# Altium project Flyback Converter.PrjPcb
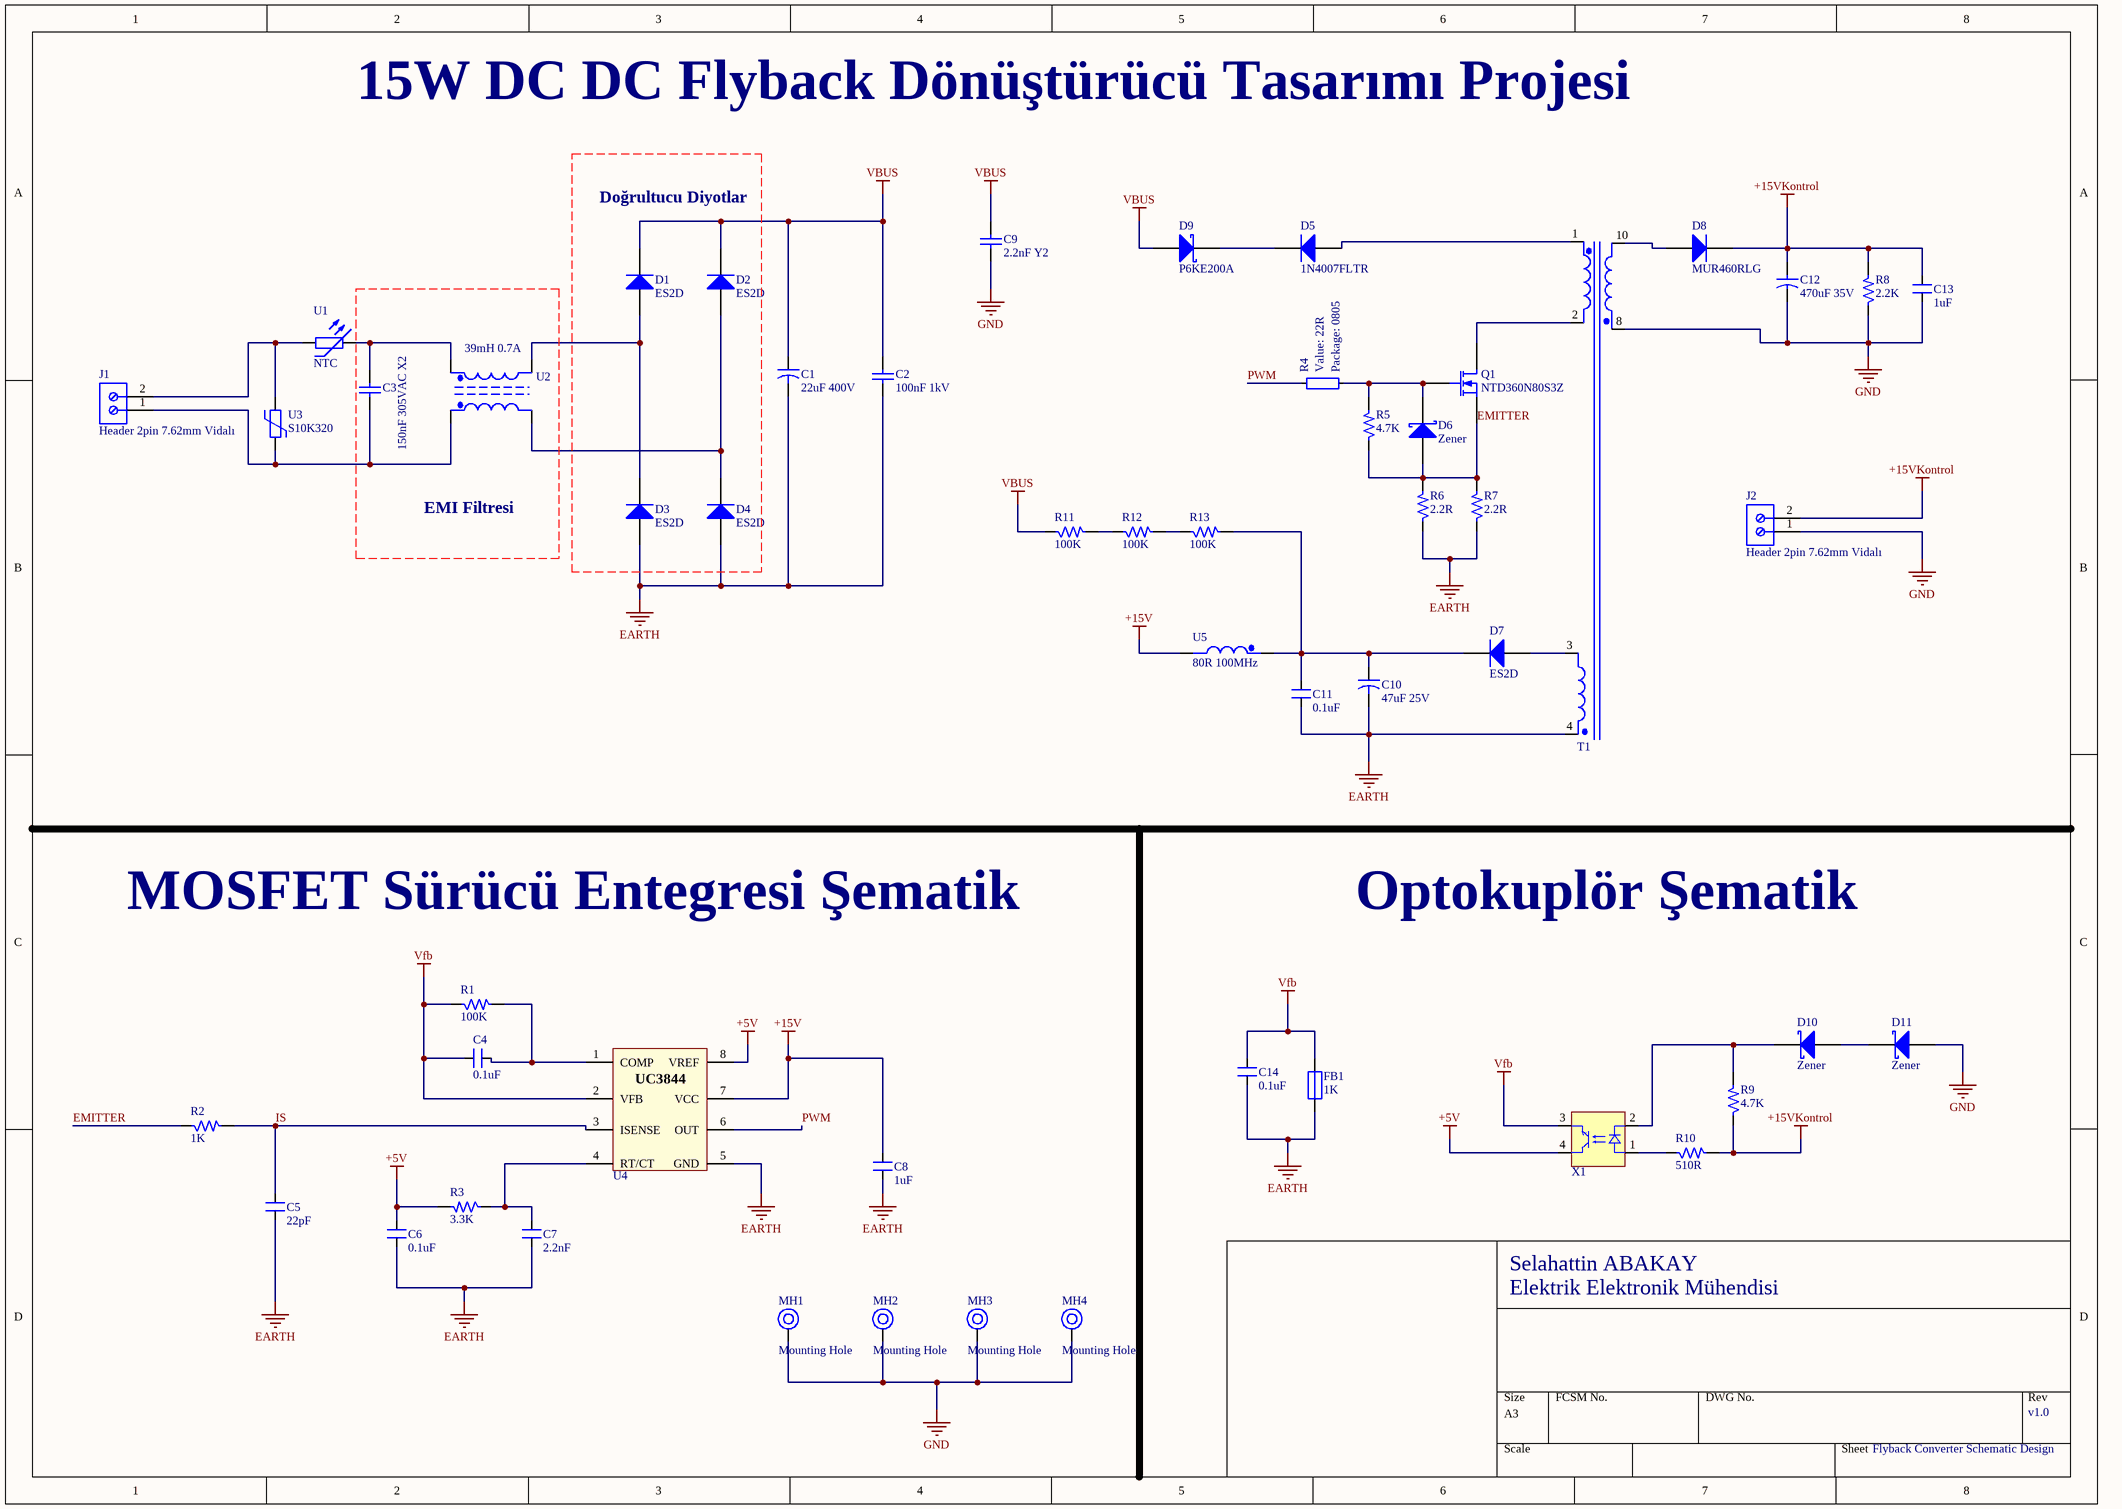
[diagram p0: Flyback Converter.SchDoc]
1 sheet, 53 parts. Net scope: global (net labels, ports and power ports of the same name join across sheets).
Board file: Flyback Converter.PcbDoc

## Sheet Flyback Converter.SchDoc
size A3

### Parts
C1  22uF 400V  [22uF 400V]
C2  100nF 1kV  [RCE7U2J333J5B1H03B]
C3  150nF 305VAC X2  [CFR F15 L18 B6 H12]
C4  0.1uF  [CAP_0805]
C5  22pF  [CAP_0805]
C6  0.1uF  [CAP_0805]
C7  2.2nF  [CAP_0805]
C8  1uF  [CAP_0805]
C9  2.2nF Y2  [4x13x9]
C10  47uF 25V  [CAPPRD200W50D525H1250]
C11  0.1uF  [CAP_0805]
C12  470uF 35V  [CAPPRD500W60D1025H1750]
C13  1uF  [CAP_0805]
C14  0.1uF  [CAP_0805]
D1  ES2D  [DO-214AA(SMB)]
D2  ES2D  [DO-214AA(SMB)]
D3  ES2D  [DO-214AA(SMB)]
D4  ES2D  [DO-214AA(SMB)]
D5  1N4007FLTR  [DO-214AA(SMB)]
D6  Zener  [SOD-123]
D7  ES2D  [DO-214AA(SMB)]
D8  MUR460RLG  [DO-201AD -Dik]
D9  P6KE200A  [DO-15((DO-204AC)]
D10  Zener  [SOD-123]
D11  Zener  [SOD-123]
FB1  1K  [IND_0805]
J1  Header 2pin 7.62mm Vidalı  [Header 2 Pin 7.62mm Vidalı]
J2  Header 2pin 7.62mm Vidalı  [Header 2 Pin 7.62mm Vidalı]
MH1  Mounting Hole  [MOUNTING]
MH2  Mounting Hole  [MOUNTING]
MH3  Mounting Hole  [MOUNTING]
MH4  Mounting Hole  [MOUNTING]
Q1  NTD360N80S3Z  [DPAK IGBT]
R1  100K  [RES_0805]
R2  1K  [RES_0603]
R3  3.3K  [RES_0805]
R4  value 22R  Package: 0805  [Resistor_Smd_M2012_I0805]  (hidden comment: Resistor)
R5  4.7K  [RES_0805]
R6  2.2R  [RES_0603]
R7  2.2R  [RES_0603]
R8  2.2K  [RES_0805]
R9  4.7K  [RES_0805]
R10  510R  [RES_0805]
R11  100K  [RES_0805]
R12  100K  [RES_0805]
R13  100K  [RES_0805]
T1  SMPS Tr  [SMPS Tr3]  (value not drawn)
U1  NTC  [NTC B57153S0100]
U2  39mH 0.7A  [EMC SMPS TDK]
U3  S10K320  [Varistor630V]
U4  UC3844  [SOIC-OA8_L]  (value not drawn)
U5  80R 100MHz  [1206 Bead]
X1  PC81710NIP1B  [PC817 SMD]  (value not drawn)

### Nets
+5V: C6.2 R3.2 U4.8(VREF) X1.4(C)
+15V: C8.2 U4.7(VCC) U5.2
+15VKontrol: C12.1 C13.2 D8.2(K) J2.2 R8.2 R9.1 R10.2
EARTH: C1.2 C2.1 C5.1 C6.1 C7.2 C8.1 C10.2 C11.1 C14.1 D3.1(A) D4.1(A) FB1.1 R6.1 R7.1 T1.4(Sec3-) U4.5(GND)
GND: C9.1 C12.2 C13.1 D11.1(A) J2.1 MH1.1 MH2.1 MH3.1 MH4.1 R8.1 T1.8
VBUS: C1.1 C2.2 C9.2 D1.2(K) D2.2(K) D9.1(A) R11.1
Vfb: C4.1 C14.2 FB1.2 R1.1 U4.2(VFB) X1.3(E)
EMITTER: D6.1(A) Q1.3(S) R2.1 R5.1 R6.2 R7.2
IS: C5.2 R2.2 U4.3(ISENSE)
PWM: R4.1 U4.6(OUT)
NetC3_1: C3.1 J1.1 U2.1 U3.1
NetC3_2: C3.2 U1.2 U2.2
NetC4_2: C4.2 R1.2 U4.1(COMP)
NetC7_1: C7.1 R3.1 U4.4(RT/CT)
NetC10_1: C10.1 C11.2 D7.2(K) R13.2 U5.1
NetD1_1: D1.1(A) D3.2(K) U2.3
NetD2_1: D2.1(A) D4.2(K) U2.4
NetD5_1: D5.1(A) T1.1(Pri+)
NetD5_2: D5.2(K) D9.2(K)
NetD6_2: D6.2(K) Q1.1(G) R4.2 R5.2
NetD7_1: D7.1(A) T1.3(Sec3+)
NetD8_1: D8.1(A) T1.10(Sec1+)
NetD10_1: D10.1(A) D11.2(K)
NetD10_2: D10.2(K) R9.2 X1.2(K)
NetJ1_2: J1.2 U1.1 U3.2
NetQ1_2: Q1.2(D) T1.2(Pri-)
NetR10_1: R10.1 X1.1(A)
NetR11_2: R11.2 R12.1
NetR12_2: R12.2 R13.1

### Notes on the sheet
- 15W DC DC Flyback Dönüştürücü Tasarımı Projesi
- Doğrultucu Diyotlar
- EMI Filtresi
- MOSFET Sürücü Entegresi Şematik
- Optokuplör Şematik
- Elektrik Elektronik Mühendisi
- Selahattin ABAKAY
- Flyback Converter Schematic Design
- v1.0

### Library data of the parts
C1 = C 22uF 400V 270mArms: 400AX22MEFC12.5X16; Manufacturer_Name: AVX; Manufacturer_Part_Number: TPSE107K020R0150; Allied_Number: 70002020; Datasheet Link: http://datasheets.avx.com/TPS.pdf; Height: 4.3mm; Mouser Part Number: 581-TPSE107K020R0150; Mouser Price/Stock: https://www.mouser.com/Search/Refine.aspx?Keyword=581-TPSE107K020R0150; RS Part Number: 1359911P; RS Price/Stock: http://uk.rs-online.com/web/p/products/1359911P; Allied Price/Stock: http://www.alliedelec.com/avx-tpse107k020r0150/70002020/
C2 = C Seramik 100nF 1kV X7R 5mm: 490-8944-ND; Published: 8-Jun-2000; LatestRevisionDate: 17-Jul-2002; LatestRevisionNote: Re-released for DXP Platform.; PackageReference: RAD-0.3; Publisher: Altium Limited; PackageDescription: Radial Cap, Thru-Hole; 2 Leads; 0.3 in Pin Spacing
C3 = Cap 150nF 305VAC X2: 1572-1789-ND; Part Number: 890273322005CS; Insulation Resistance: 30000MOhm; Dissipation Factor@100kHz: 0.26%; Dissipation Factor@1kHz: 0.1%; Pitch: 7.5mm; Rated Voltage: 250VDC; Rate of Voltage Rise: 340V/us; Technical Reference: MPPP075154J250DCPP45004; ComponentLink1Description: Manufacturer; ComponentLink1URL: http://www.we-online.de; ComponentLink2Description: Datasheet; ComponentLink2URL: https://katalog.we-online.com/pbs/datasheet/890273322005CS.pdf; Length: 10.5mm; Mounting Technology: THT; Packaging: Carton; Operating Temperature: -40 to +105degC; Width: 5mm; Capacitance: 150nF; Dissipation Factor@10kHz: 0.1%; Height: 11mm; Publisher: Wurth Elektronik; Published Date: August 2019
C4 C14 = CAP_0.1uF-50V-10%-0805: 0.1µF ±10% 50V Ceramic Capacitor X7R 0805 (2012 Metric) /; Manufacturer: Samsung; Manufacturer Part Number: CL21B104KBCNNNC; Alternate Part Number-1: NA; Case/Package: 0805; Supplier-1: SIRICOM; Supplier Part Number-1: 0805B104K500CT
C5 = CAP_22PF-50V-5%-0805: 22pF ±5% 50V Ceramic Capacitor C0G, NP0 0805 (2012 Metric) /; Manufacturer: Yageo; Manufacturer Part Number: CC0805JRNPO9BN220; Alternate Part Number-1: 0805CG220J500NT; Case/Package: 0805; Supplier-1: SIRICOM; Supplier Part Number-1: 0805N220J500CT
C6 C11 = CAP_0.1uF-50V-20%-0805: 0.1µF ±20% 50V Ceramic Capacitor X7R 0805 (2012 Metric) /; Manufacturer: Samsung Electro-Mechanics; Manufacturer Part Number: CL21B104MBCNNNC; Alternate Part Number-1: NA; Case/Package: 0805; Supplier-1: SIRICOM; Supplier Part Number-1: 0805B104K500CT
C7 = CAP_2.2nF-50V-10%-0805: 2200pF ±10% 50V Ceramic Capacitor C0G, NP0 0805 (2012 Metric) /; Manufacturer: KEMET; Manufacturer Part Number: C0805C222K5GEC7800; Alternate Part Number-1: NA; Case/Package: 0805; Supplier-1: SIRICOM; Supplier Part Number-1: 0805N222J500LT
C8 C13 = CAP_1uF-50V-5%-0805: 1µF ±5% 50V Ceramic Capacitor X7R 0805 (2012 Metric) /; Manufacturer: Samsung; Manufacturer Part Number: CC0805JKX7R9BB105; Alternate Part Number-1: 0805F105M500NT; Case/Package: 0805; Supplier-1: SIRICOM; Supplier Part Number-1: CL21B105KBFNNNE
C9 = Cap Y2 2.2nF 300V MKP TDK: 495-4967-1-ND; Published: 8-Jun-2000; LatestRevisionDate: 17-Jul-2002; LatestRevisionNote: Re-released for DXP Platform.; PackageReference: RAD-0.3; Publisher: Altium Limited; PackageDescription: Radial Cap, Thru-Hole; 2 Leads; 0.3 in Pin Spacing
C10 = C 47uF 25V 250mArms 400mOhm: 1189-1590-1-ND; ComponentLink1Description: http://www.rubycon.co.jp/en/catalog/e_pdfs/aluminum/e_px.pdf
C12 = C 470uF 35V 1.76A 28mOhm: 860040475008; Published: 8-Jun-2000; LatestRevisionDate: 17-Jul-2002; LatestRevisionNote: Re-released for DXP Platform.; PackageReference: RAD-0.3; Publisher: Altium Limited; PackageDescription: Radial Cap, Thru-Hole; 2 Leads; 0.3 in Pin Spacing
D1-D4 D7 = D ES2D: ES2DFSCT-ND
D5 = D 1N4007 DO-214AA(SMB): 1655-1N4007FLCT-ND
D6 D10 D11 = Zener SOD-123: SOD-123; Note: Pin 2 is not connected and not drawn.; Published: 21-Mar-2003; LatestRevisionDate: 29-May-2009; LatestRevisionNote: IPC-7351 Footprint Added.; DatasheetVersion: Oct-1999; PackageVersion: Sep-2001; PackageReference: SOT-23; Publisher: Altium Limited; PackageDescription: 3-Pin SOT-23 Package 0.95 mm Pitch, 2.5 mm Lead Span; ComponentLink1Description: Manufacturer Link; ComponentLink1URL: http://www.infineon.com/; ComponentLink2Description: Datasheet; ComponentLink2URL: http://www.infineon.com/upload/Document/cmc_upload/documents/009/363/bat17series.pdf
D8 = Diyot DO-201AD Dik: MUR460RLGOSCT-ND
D9 = TVS 200V DO-15: 497-13419-1-ND; Note: Pin 2 is not connected and not drawn.; Published: 21-Mar-2003; LatestRevisionDate: 29-May-2009; LatestRevisionNote: IPC-7351 Footprint Added.; DatasheetVersion: Oct-1999; PackageVersion: Sep-2001; PackageReference: SOT-23; Publisher: Altium Limited; PackageDescription: 3-Pin SOT-23 Package 0.95 mm Pitch, 2.5 mm Lead Span; ComponentLink1Description: Manufacturer Link; ComponentLink1URL: http://www.infineon.com/; ComponentLink2Description: Datasheet; ComponentLink2URL: http://www.infineon.com/upload/Document/cmc_upload/documents/009/363/bat17series.pdf
FB1 = FB_1K-100MHZ-1.6A-0805: 1 kOhms @ 100MHz 1 Power Line Ferrite Bead 0805 (2012 Metric) 1.6A; Manufacturer: Laird; Manufacturer Part Number: BLM21SP102SH1D; Alternate Part Number-1: NA; Case/Package: 0805; Supplier-1: SIRICOM; Supplier Part Number-1: ACMS201209A102
J1 J2 = Header 2pin 7.62mm Vidalı: 691214410002; Part Number: 691218410002; Compliance: Lead free / RoHS; Modularity: Yes; PCB/Cable/Panel: PCB; Pin Number: 2; Rated Current [UL]: 30A; Working Voltage [UL]: 300VAC; ComponentLink1Description: Manufacturer; ComponentLink1URL: http://www.we-online.de; ComponentLink2URL: https://katalog.we-online.de/em/datasheet/691218410002.pdf; ComponentLink2Description: Datasheet; Mounting Technology: THT; Packaging: Box; Operating Temperature: -40 to +105degC; Pitch: 7.62mm; Published Date: October 2019; Type: Horizontal; Publisher: Wurth Elektronik; Application: Rising Cage Clamp
MH1-MH4 = MH_3.5H_6D: Manufacturer Part Number: NA; Case/Package: TH; Manufacturer: NA; Supplier-1: NA; Supplier Part Number-1: NA; Alternate Part Number-1: NA
Q1 = MOSFET DPAK: DPAK; Published: 8-Jun-2000; LatestRevisionDate: 17-Jul-2002; LatestRevisionNote: Re-released for DXP Platform.; PackageVersion: 1995/1996; PackageReference: E3; Publisher: Altium Limited; PackageDescription: TO, Flat Index; 3 In-Line, Axial Leads; Body Dia. 4.6mm; Lead Dia. 0.5 mm (max)
R1 R11-R13 = RES_100K-0.125W-1%-0805: 100 kOhms ±1% 0.125W, 1/8W Chip Resistor 0805 (2012 Metric) Automotive AEC-Q200 Thick Film /; Manufacturer: Walsin; Manufacturer Part Number: WR08X1003FTL; Alternate Part Number-1: NA; Case/Package: 0805; Supplier-1: SIRICOM; Supplier Part Number-1: WR08X1003FTL
R2 = RES_1K-0.1W-1%-0603: 1 kOhms ±1% 0.1W, 1/10W Chip Resistor 0603 (1608 Metric) Automotive AEC-Q200 Thick Film /; Manufacturer: Walsin; Manufacturer Part Number: WR06X1001FTL; Alternate Part Number-1: 0603WAF1001T5E; Case/Package: 0603; Supplier-1: SIRICOM; Supplier Part Number-1: WR06X1001FTL
R3 = RES_3.3K-0.125W-1%-0805: 3.3 kOhms ±1% 0.125W, 1/8W Chip Resistor 0805 (2012 Metric) Thick Film /; Manufacturer: Panasonic; Manufacturer Part Number: 1623214-1; Alternate Part Number-1: 0805W8F3301T5E; Case/Package: 0805; Supplier-1: SIRICOM; Supplier Part Number-1: WR08X3301FTL
R5 R9 = RES_4.7K-0.125W-1%-0805: 4.7 kOhms ±1% 0.125W, 1/8W Chip Resistor 0805 (2012 Metric) Moisture Resistant Thick Film /; Manufacturer: TE Connectivity; Manufacturer Part Number: RC0805FR-074K7L; Alternate Part Number-1: 0805W8F4701T5E; Case/Package: 0805; Supplier-1: SIRICOM; Supplier Part Number-1: WR08X4701FTL
R6 R7 = RES_2.2R-0.1W-1%-0603: 2.2 Ohms ±1% 0.1W, 1/10W Chip Resistor 0603 (1608 Metric) Automotive AEC-Q200, Current Sense Thick Film /; Manufacturer: Panasonic Electronic Components; Manufacturer Part Number: ERJ-3RQF2R2V; Alternate Part Number-1: NA; Case/Package: 0603; Supplier-1: SIRICOM; Supplier Part Number-1: NA
R8 = RES_2.2K-0.125W-1%-0805: 2.2 kOhms ±1% 0.125W, 1/8W Chip Resistor 0805 (2012 Metric) Thick Film /; Manufacturer: Stackpole Electronics; Manufacturer Part Number: CRG0805F2K2; Alternate Part Number-1: CR0805F82201G; Case/Package: 0805; Supplier-1: SIRICOM; Supplier Part Number-1: WR08X2201FTL
R10 = RES_510R-0.125W-1%-0805: 510 Ohms ±1% 0.125W, 1/8W Chip Resistor 0805 (2012 Metric) Thin Film /; Manufacturer: Yageo; Manufacturer Part Number: RT0805FRE07510RL; Alternate Part Number-1: NA; Case/Package: 0805; Supplier-1: SIRICOM; Supplier Part Number-1: WR08X5100FTL
T1 = SMPS Tr EF25: Sim Note: Enter the turns ratios, Core loss resistance, Magnetising Reactance, Leakage Reactances and Resistances referred to the primary side into the parameter fields.; Published: 25-Jan-2001; LatestRevisionDate: 17-Jul-2002; LatestRevisionNote: Re-released for DXP Platform.; PackageReference: TRF_8; Publisher: Altium Limited; PackageDescription: Transformer; 8 Leads
U1 = NTC 10R 2A 8.5mm: 495-2076-ND; Published: 8-Jun-2000; LatestRevisionDate: 17-Jul-2002; LatestRevisionNote: Re-released for DXP Platform.; PackageReference: AXIAL-0.4; Publisher: Altium Limited; PackageDescription: Axial Device, Thru-Hole; 2 Leads; 0.4 in Pin Spacing
U2 = EMC SMPS TDK 39mH 0.7A: 495-2781-ND
U3 = Varistor S10K320: Published: 8-Jun-2000; LatestRevisionDate: 17-Jul-2002; LatestRevisionNote: Re-released for DXP Platform.; PackageReference: AXIAL-0.4; Publisher: Altium Limited; PackageDescription: Axial Device, Thru-Hole; 2 Leads; 0.4 in Pin Spacing
U4 = UC3844: SOIC8; PackageReference: SOIC-OA8
U5 = Bead 1206: SMD 1206
X1 = PC817: 1855-1014-1-ND
R4 = Resistor: Component Category: Resistor; Component Type: Fixed Value; Tolerance: *; Supplier Link: *; Supplier Currency: *; Price, Max: *; Price, Min: *; Quantity, Max: *; Quantity, Min: *; Operating Temperature, Max: *℃; Operating Temperature, Min: *℃; Manufacturer: *; Supplier Part Number: *; Supplier: *; Manufacturer Part Number: *; ComponentLink1Description: Datasheet; ComponentLink1URL: *; ComponentLink2Description: Supplier Link; ComponentLink2URL: *